# Altium schematic sheet Peripheral Sheet.SchDoc
size A4; SheetNumber: 3; SheetTotal: 5
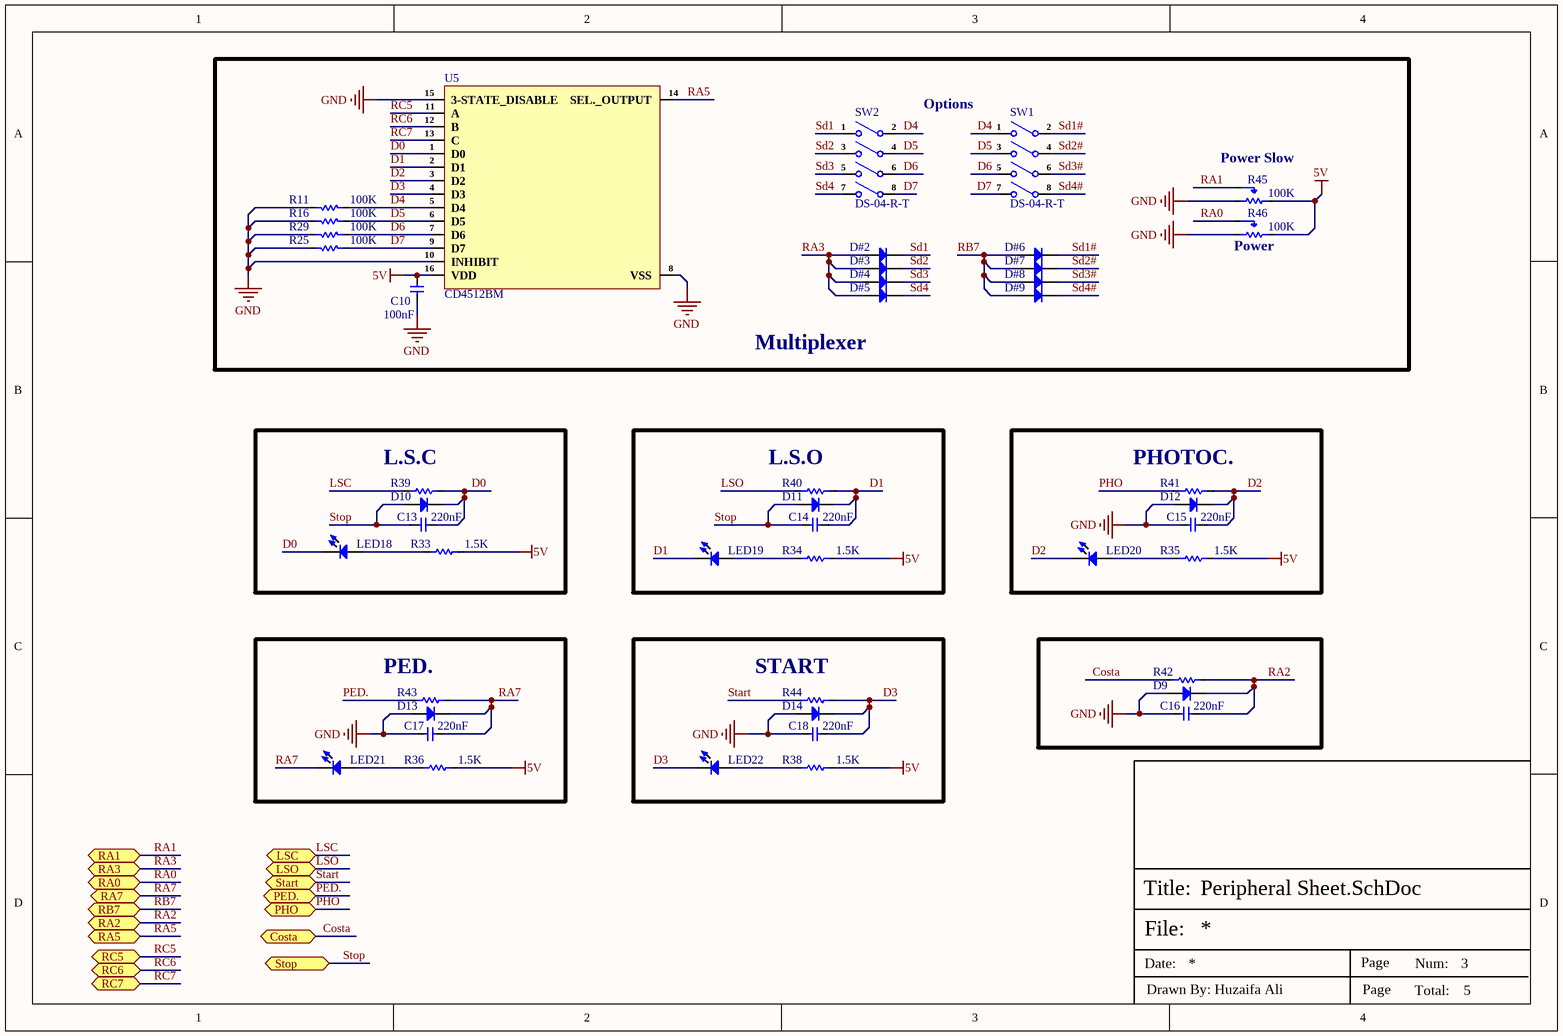
[diagram p0: Peripheral Sheet.SchDoc]

## Parts
C10  100nF  [Cap-0603]
C13  220nF  [Cap-0805]
C14  220nF  [Cap-0805]
C15  220nF  [Cap-0805]
C16  220nF  [Cap-0805]
C17  220nF  [Cap-0805]
C18  220nF  [Cap-0805]
D9  1N4148W-7-F  [SOD-123]  (value not drawn)
D10  1N4148W-7-F  [SOD-123]  (value not drawn)
D11  1N4148W-7-F  [SOD-123]  (value not drawn)
D12  1N4148W-7-F  [SOD-123]  (value not drawn)
D13  1N4148W-7-F  [SOD-123]  (value not drawn)
D14  1N4148W-7-F  [SOD-123]  (value not drawn)
D#2  1N4148W-7-F  [SOD-123]  (value not drawn)
D#3  1N4148W-7-F  [SOD-123]  (value not drawn)
D#4  1N4148W-7-F  [SOD-123]  (value not drawn)
D#5  1N4148W-7-F  [SOD-123]  (value not drawn)
D#6  1N4148W-7-F  [SOD-123]  (value not drawn)
D#7  1N4148W-7-F  [SOD-123]  (value not drawn)
D#8  1N4148W-7-F  [SOD-123]  (value not drawn)
D#9  1N4148W-7-F  [SOD-123]  (value not drawn)
LED18  Blue  [LED-0603]  (value not drawn)
LED19  Blue  [LED-0603]  (value not drawn)
LED20  Blue  [LED-0603]  (value not drawn)
LED21  Blue  [LED-0603]  (value not drawn)
LED22  Blue  [LED-0603]  (value not drawn)
R11  100K  [Res-0603]
R16  100K  [Res-0603]
R25  100K  [Res-0603]
R29  100K  [Res-0603]
R33  1.5K  [Res-0603]
R34  1.5K  [Res-0603]
R35  1.5K  [Res-0603]
R36  1.5K  [Res-0603]
R38  1.5K  [Res-0603]
R39  100R  [Res-0603]  (value not drawn)
R40  100R  [Res-0603]  (value not drawn)
R41  100R  [Res-0603]  (value not drawn)
R42  100R  [Res-0603]  (value not drawn)
R43  100R  [Res-0603]  (value not drawn)
R44  100R  [Res-0603]  (value not drawn)
R45  100K  [PT15-L-V-104(100K)]
R46  100K  [PT15-L-V-104(100K)]
SW1  DS-04-R-T  [DS-04-R-T]
SW2  DS-04-R-T  [DS-04-R-T]
U5  CD4512BM  [SOIC-16]

## Blocks framed on the sheet
Multiplexer: C10 D#2-D#9 R11 R16 R25 R29 R45 R46 SW1 SW2 U5
L.S.C: C13 D10 LED18 R33 R39
L.S.O: C14 D11 LED19 R34 R40
PHOTOC.: C15 D12 LED20 R35 R41
PED.: C17 D13 LED21 R36 R43
START: C18 D14 LED22 R38 R44

## Ports
Costa (bidir, see Top Sheet[3B], Connector Sheet[1D], Controller Sheet[1D]), LSC (bidir, see Top Sheet[3B], Connector Sheet[1C]), LSO (bidir, see Top Sheet[3B], Connector Sheet[1C]), PED. (bidir, see Top Sheet[3B], Connector Sheet[1C]), PHO (bidir, see Top Sheet[3B], Connector Sheet[1C]), RA0 (bidir, see Top Sheet[3B], Controller Sheet[1D]), RA1 (bidir, see Top Sheet[3B], Controller Sheet[1D]), RA2 (bidir, see Top Sheet[3B], Controller Sheet[1D]), RA3 (bidir, see Top Sheet[3B], Controller Sheet[1D]), RA5 (bidir, see Top Sheet[3C], Controller Sheet[1D]), RA7 (bidir, see Top Sheet[3C], Controller Sheet[1D]), RB7 (bidir, see Top Sheet[3C], Controller Sheet[1D]), RC5 (bidir, see Top Sheet[3C], Controller Sheet[1D]), RC6 (bidir, see Top Sheet[3C], Controller Sheet[1D]), RC7 (bidir, see Top Sheet[3C], Controller Sheet[1D]), Start (bidir, see Top Sheet[3A], Connector Sheet[1C]), Stop (bidir, see Top Sheet[3B], Connector Sheet[1D])

## Nets
5V: C10.2 R33.1 R34.1 R35.1 R36.1 R38.1 R45.3(CW) R46.3(CW) U5.16(VDD)
GND: C10.1 C15.1 C16.1 C17.1 C18.1 D9.1(A) D12.1(A) D13.1(A) D14.1(A) R11.2 R16.2 R25.2 R29.2 R45.1(CCW) R46.1(CCW) U5.8(VSS) U5.10(INHIBIT) U5.15(3-STATE_DISABLE)
Costa: R42.2 ; port Costa
D0: C13.2 D10.2(K) LED18.2 R39.1 U5.1(D0)
D1: C14.2 D11.2(K) LED19.2 R40.1 U5.2(D1)
D2: C15.2 D12.2(K) LED20.2 R41.1 U5.3(D2)
D3: C18.2 D14.2(K) LED22.2 R44.1 U5.4(D3)
D4: R11.1 SW1.1 SW2.2 U5.5(D4)
D5: R16.1 SW1.3 SW2.4 U5.6(D5)
D6: R29.1 SW1.5 SW2.6 U5.7(D6)
D7: R25.1 SW1.7 SW2.8 U5.9(D7)
LSC: R39.2 ; port LSC
LSO: R40.2 ; port LSO
PED.: R43.2 ; port PED.
PHO: R41.2 ; port PHO
RA0: R46.2(Wiper) ; port RA0
RA1: R45.2(Wiper) ; port RA1
RA2: C16.2 D9.2(K) R42.1 ; port RA2
RA3: D#2.1(A) D#3.1(A) D#4.1(A) D#5.1(A) ; port RA3
RA5: U5.14(SEL._OUTPUT) ; port RA5
RA7: C17.2 D13.2(K) LED21.2 R43.1 ; port RA7
RB7: D#6.1(A) D#7.1(A) D#8.1(A) D#9.1(A) ; port RB7
RC5: U5.11(A) ; port RC5
RC6: U5.12(B) ; port RC6
RC7: U5.13(C) ; port RC7
Sd1: D#2.2(K) SW2.1
Sd1#: D#6.2(K) SW1.2
Sd2: D#3.2(K) SW2.3
Sd2#: D#7.2(K) SW1.4
Sd3: D#4.2(K) SW2.5
Sd3#: D#8.2(K) SW1.6
Sd4: D#5.2(K) SW2.7
Sd4#: D#9.2(K) SW1.8
Start: R44.2 ; port Start
Stop: C13.1 C14.1 D10.1(A) D11.1(A) ; port Stop
NetLED18_1: LED18.1 R33.2
NetLED19_1: LED19.1 R34.2
NetLED20_1: LED20.1 R35.2
NetLED21_1: LED21.1 R36.2
NetLED22_1: LED22.1 R38.2

## Notes on the sheet
- Options
- (near R45) Power Slow
- (near R46) Power
- File:
- Title:
- Date:
- Page
- Num:
- Total:
- Drawn By: Huzaifa Ali

## Library data of the parts
C10 = CC0603KRX5R9BB104: CAP CER 0.1UF 50V X5R 0603; Manufacturer: Yageo; Tolerance: 10%; Item Type: Capacitor; Supplier 1: Digi-Key; Manufacturer Part Number: CC0603KRX5R9BB104; RoHS: Yes; Category: Ceramic Capacitors; Stock 1: 152253; Pricing 1: 1=0.10000, 10=0.05200, 50=0.02820, 100=0.02310, 500=0.01648, 1000=0.01294 (USD); Mount: Surface Mount; Case/Package: 0603; Case Code (Imperial): 0603; Case Code (Metric): 1608; Weight: 7.1E-05oz; Min Operating Temperature: -55°C; Max Operating Temperature: 85°C; Capacitance: 100nF; Packaging: Tape and Reel; Voltage Rating: 50V; Dielectric: X5R; Termination: SMD/SMT; Voltage Rating (DC): 50V; Package Quantity: 4000; Length: 0.063inch; Width: 0.031inch; Thickness: 0.035inch; Lead Free: Lead Free; Halogen Free: Halogen Free; ComponentLink1URL: http://www.mouser.com/ds/2/447/Yageo_UPY-GP_NP0_16V-to-50V_9-358835.pdf?src-supplier=Mouser; ComponentLink1Description: http://www.mouser.com/ds/2/447/Yageo_UPY-GP_NP0_16V-to-50V_9-358835.pdf?src-supplier=Mouser; ComponentLink2URL: https://www.yageo.com/upload/media/product/productsearch/datasheet/mlcc/UPY-GPHC_X5R_4V-to-50V_26.pdf?src-supplier=Digi-Key; ComponentLink2Description: https://www.yageo.com/upload/media/product/productsearch/datasheet/mlcc/UPY-GPHC_X5R_4V-to-50V_26.pdf?src-supplier=Digi-Key; ComponentLink3URL: http://www.yageo.com/exep/pages/download/literatures/ProductSelectionGuide%202014_Final_2.pdf?src-supplier=Digi-Key; ComponentLink3Description: http://www.yageo.com/exep/pages/download/literatures/ProductSelectionGuide%202014_Final_2.pdf?src-supplier=Digi-Key; Supplier Part Number 1: 311-4046-1-ND; LCSC Part Number: C110022
C13-C18 = 08051C224K4T2A: CAP CER 0.22UF 100V X7R 0805; Manufacturer: Kyocera AVX; Tolerance: 10%; Item Type: Capacitor; Supplier 1: Digi-Key; Manufacturer Part Number: 08051C224K4T2A; RoHS: Yes; Category: Ceramic Capacitors; Stock 1: 151; Pricing 1: 1=0.27000, 10=0.18500, 50=0.12320, 100=0.10470, 500=0.07392, 1000=0.06468 (USD); Mount: Surface Mount; Case/Package: 0805; Contact Plating: Tin; Min Operating Temperature: -55°C; Max Operating Temperature: 125°C; Termination: Wraparound; Capacitance: 220nF; Dielectric: X7R; Voltage Rating (DC): 100V; Length: 2.01mm; RoHS Compliant: Yes; ComponentLink1URL: http://datasheets.avx.com/AutoMLCC.pdf?src-supplier=Avnet+Asia; ComponentLink1Description: http://datasheets.avx.com/AutoMLCC.pdf?src-supplier=Avnet+Asia; Supplier Part Number 1: 478-13049-1-ND; LCSC Part Number: C2176107
D9-D14 D#2-D#9 = 1N4148W-7-F: DIODE GEN PURP 100V 300MA SOD123; Manufacturer: Diodes; Forward Current: 150mA; Reverse Recovery Time: 4ns; Max Forward Surge Current (Ifsm): 2A; Element Configuration: Single; Max Reverse Current: 1uA; Forward Voltage: 1.25V; Power Dissipation: 400mW; Polarity: Standard; Voltage Rating (DC): 75V; Value: 2pF; Supplier 1: Future Electronics; Manufacturer Part Number: 1N4148W-7-F; RoHS: Yes; Category: Rectifier Diodes; Stock 1: 32931000; Pricing 1: 3000=0.01840, 12000=0.01760, 45000=0.01690, 120000=0.01640, 300000=0.01560 (USD); Mounting Technology: Surface Mount; Pins: 2; Weight: 0.000353oz; Contact Plating: Tin,Matte; Min Operating Temperature: -65°C; Max Operating Temperature: 150°C; Packaging: Tape and Reel; Max Repetitive Reverse Voltage (Vrrm): 100V; Peak Non-Repetitive Surge Current: 2A; Voltage: 100V; Max Surge Current: 2A; Package Quantity: 3000; Recovery Time: 4ns; Average Rectified Current: 300mA; Power Rating: 400mW; Current Rating: 150mA; Output Current: 150mA; Max Reverse Voltage (DC): 100V; Series: -; Reverse Recovery Time-Max: 4ns; Length: 2.85mm; Width: 1.7mm; Height: 1.25mm; Radiation Hardening: No; RoHS Compliant: Yes; Reach SVHC Compliant: Yes; Lead Free: Lead Free; ComponentLink1URL: https://datasheet.ciiva.com/1179/1915529-1179304.pdf?src-supplier=Element14; ComponentLink1Description: https://datasheet.ciiva.com/1179/1915529-1179304.pdf?src-supplier=Element14; ComponentLink2URL: https://datasheet.ciiva.com/22695/1915529-22695239.pdf?src-supplier=Element14; ComponentLink2Description: https://datasheet.ciiva.com/22695/1915529-22695239.pdf?src-supplier=Element14; ComponentLink3URL: https://datasheet.ciiva.com/8300/ds30086-8300392.pdf?src-supplier=Avnet; ComponentLink3Description: https://datasheet.ciiva.com/8300/ds30086-8300392.pdf?src-supplier=Avnet; ComponentLink4URL: https://datasheet.ciiva.com/15219/getdatasheetpartid-110030-15219548.pdf?src-supplier=Verical; ComponentLink4Description: https://datasheet.ciiva.com/15219/getdatasheetpartid-110030-15219548.pdf?src-supplier=Verical; ComponentLink5URL: https://datasheet.ciiva.com/8303/ds30086-8303197.pdf?src-supplier=Avnet; ComponentLink5Description: https://datasheet.ciiva.com/8303/ds30086-8303197.pdf?src-supplier=Avnet; ComponentLink6URL: https://datasheet.ciiva.com/911/ds30086-911735.pdf?src-supplier=Digi-Key; ComponentLink6Description: https://datasheet.ciiva.com/911/ds30086-911735.pdf?src-supplier=Digi-Key; ComponentLink7URL: https://datasheet.ciiva.com/911/ds30086-911736.pdf?src-supplier=Digi-Key; ComponentLink7Description: https://datasheet.ciiva.com/911/ds30086-911736.pdf?src-supplier=Digi-Key; ComponentLink8URL: https://datasheet.ciiva.com/911/ds30086-911734.pdf?src-supplier=Digi-Key; ComponentLink8Description: https://datasheet.ciiva.com/911/ds30086-911734.pdf?src-supplier=Digi-Key; ComponentLink9URL: https://datasheet.ciiva.com/4435/ds30086-4435128.pdf?src-supplier=Mouser; ComponentLink9Description: https://datasheet.ciiva.com/4435/ds30086-4435128.pdf?src-supplier=Mouser; Supplier Part Number 1: 7634694; LCSC Part Number: C83528; Item Type: Diode
LED18-LED22 = NCD0603B3: blue 0603 Light Emitting Diodes (LED) ROHS; Manufacturer: Foshan NationStar Optoelectronics; Manufacturer Part Number: NCD0603B3; Package: 0603; LCSC Part Number: C158101; Item Type: LED; ComponentLink1Description: LCSC; ComponentLink1URL: https://www.lcsc.com/product-detail/Light-Emitting-Diodes-LED_Foshan-NationStar-Optoelectronics-NCD0603B3_C158101.html
R11 R16 R25 R29 = RC0603JR-07100KL: RES 100K OHM 5% 1/10W 0603; Manufacturer: Yageo; Resistance: 100kR; Temperature Coefficient: 100ppm/°C; Voltage Rating: 50V; Power Rating: 100mW; Item Type: Resistor; Supplier 1: Digi-Key; Manufacturer Part Number: RC0603JR-07100KL; RoHS: Yes; Category: Chip SMD Resistors; Stock 1: 1210037; Pricing 1: 1=0.10000, 10=0.02000, 100=0.00800, 1000=0.00360, 2500=0.00312 (USD); Case/Package: 0603; Number of Pins: 2; Contact Plating: Tin,Matte; Case Code (Imperial): 0603; Case Code (Metric): 1608; Size Code: 0603; Min Operating Temperature: -55°C; Max Operating Temperature: 155°C; Tolerance: 5%; Resistor Type: Thick Film; Packaging: Tape and Reel; Voltage Rating (DC): 50V; Termination: SMD/SMT; Features: Moisture Resistant; Series: RC; Max Power Dissipation: 100mW; Number of Terminations: 2; Resistance Tolerance: 5%; Width: 0.8mm; Radiation Hardening: No; REACH SVHC: No SVHC; Lead Free: Lead Free; RoHS Compliant: Yes; ComponentLink1URL: https://datasheet.ciiva.com/7746/443971-7746424.pdf?src-supplier=Element14; ComponentLink1Description: https://datasheet.ciiva.com/7746/443971-7746424.pdf?src-supplier=Element14; ComponentLink2URL: https://datasheet.ciiva.com/7983/443971-7983686.pdf?src-supplier=Element14; ComponentLink2Description: https://datasheet.ciiva.com/7983/443971-7983686.pdf?src-supplier=Element14; ComponentLink3URL: https://datasheet.ciiva.com/7746/443971-7746423.pdf?src-supplier=Element14; ComponentLink3Description: https://datasheet.ciiva.com/7746/443971-7746423.pdf?src-supplier=Element14; ComponentLink4URL: https://datasheet.ciiva.com/8887/pyu-rc0603-51-rohs-l-4-8887903.pdf?src-supplier=Avnet; ComponentLink4Description: https://datasheet.ciiva.com/8887/pyu-rc0603-51-rohs-l-4-8887903.pdf?src-supplier=Avnet; Supplier Part Number 1: 311-100KGRCT-ND; LCSC Part Number: C100048
R33-R36 R38 = RC0603FR-071K5L: RES 1.5K OHM 1% 1/10W 0603; Manufacturer: Yageo; Voltage Rating (DC): 50V; Resistance: 1.5kR; Temperature Coefficient: 100ppm/°C; Power Rating: 100mW; Item Type: Resistor; Supplier 1: Arrow Electronics; Manufacturer Part Number: RC0603FR-071K5L; RoHS: Yes; Category: Chip SMD Resistors; Stock 1: 15000; Pricing 1: 1=0.00160, 5000=0.00160 (USD); Case/Package: 0603; Number of Pins: 2; Case Code (Metric): 1608; Case Code (Imperial): 0603; Size Code: 0603; Min Operating Temperature: -55°C; Max Operating Temperature: 155°C; Tolerance: 1%; Packaging: Tape and Reel; Resistor Type: Thick Film; Voltage Rating: 50V; Package Quantity: 1; Number of Terminations: 2; Termination: SMD/SMT; Max Power Dissipation: 100mW; Features: Moisture Resistant; Series: RC; Resistance Tolerance: 1%; Construction: Rectangular; Length: 0.063inch; Width: 0.031inch; Height: 0.022inch; Depth: 0.8mm; REACH SVHC: No SVHC; Lead Free: Lead Free; Military Standard: Not; RoHS Compliant: Yes; Supplier Part Number 1: RC0603FR-071K5L; LCSC Part Number: C114668
R39-R44 = RC0603FR-07100RL: RES SMD 100 OHM 1% 1/10W 0603; Manufacturer: Yageo; Temperature Coefficient: 100ppm/°C; Voltage Rating (DC): 50V; Power Rating: 100mW; Item Type: Resistor; Supplier 1: Arrow Electronics; Manufacturer Part Number: RC0603FR-07100RL; RoHS: Yes; Category: Chip SMD Resistors; Stock 1: 3800000; Pricing 1: 5000=0.00300, 5000=0.00200, 5000=0.00450, 50000=0.00410, 500000=0.00230, 2500000=0.00140 (USD); Case/Package: 0603; Number of Pins: 2; Case Code (Imperial): 0603; Case Code (Metric): 1608; Size Code: 0603; Min Operating Temperature: -55°C; Max Operating Temperature: 155°C; Resistance: 100R; Tolerance: 1%; Resistor Type: Thick Film; Packaging: Tape and Reel; Voltage Rating: 50V; Termination: SMD/SMT; Features: Moisture Resistant; Series: RC; Max Power Dissipation: 100mW; Number of Terminations: 2; Construction: Rectangular; Resistance Tolerance: 1%; Technology: THICK FILM; Length: 1.6mm; Width: 0.8mm; Height: 0.45mm; Depth: 0.8mm; REACH SVHC: Unknown; Lead Free: Lead Free; RoHS Compliant: Yes; Military Standard: Not; Supplier Part Number 1: RC0603FR-07100RL; LCSC Part Number: C105588
R45 R46 = PT15-L-V-104(100K): ±20% 250mW 100kΩ - Variable Resistors/Potentiometers ROHS; Manufacturer: BOCHEN; Manufacturer Part Number: PT15-L-V-104(100K); Package: Custom; LCSC Part Number: C5205120; Item Type: Potentiometer; ComponentLink1Description: LCSC; ComponentLink1URL: https://www.lcsc.com/product-detail/Variable-Resistors-Potentiometers_BOCHEN-Chengdu-Guosheng-Tech-PT15-L-V-104-100K_C5205120.html
SW1 SW2 = DS-04-R-T: 4Bit SPST 24V Red 25mA 3000次 Plugin DIP Switches ROHS; Manufacturer: kangshen; Manufacturer Part Number: 208-4; Package: Plugin; LCSC Part Number: C5123702; Item Type: DIP Switch; ComponentLink1Description: LCSC; ComponentLink1URL: https://www.lcsc.com/product-detail/DIP-Switches_CTS-Electronic-Components-208-4_C3012341.html
U5 = CD4512BM: Multiplexer 1-Element CMOS 3-ST 8-IN 16-Pin SOIC Tube; Manufacturer: Texas Instruments; Item Type: IC; Supplier: Mouser; Supplier Part Number: 595-CD4512BM; Manufacturer Part Number: CD4512BM; RoHS: Yes; Category: Integrated Circuits (ICs); Stock: 768; Pricing: 1=1.21, 10=1.03, 50=1.03, 100=1.03, 120=0.789, 520=0.718, 1000=0.542, 2520=0.529, 5000=0.512, 10000=0.505, 25000=0.499 (USD); ComponentLink1URL: https://datasheet.ciiva.com/15087/getdatasheetpartid-393294-15087392.pdf?src-supplier=Verical; ComponentLink1Description: https://datasheet.ciiva.com/15087/getdatasheetpartid-393294-15087392.pdf?src-supplier=Verical; ComponentLink2URL: https://datasheet.ciiva.com/1629/cd4512b-1629722.pdf?src-supplier=Newark; ComponentLink2Description: https://datasheet.ciiva.com/1629/cd4512b-1629722.pdf?src-supplier=Newark; ComponentLink3URL: https://datasheet.ciiva.com/6619/cd4512b-6619077.pdf?src-supplier=Digi-Key; ComponentLink3Description: https://datasheet.ciiva.com/6619/cd4512b-6619077.pdf?src-supplier=Digi-Key; ComponentLink4URL: https://datasheet.ciiva.com/14285/cd4512b-mil-14285481.pdf?src-supplier=Avnet; ComponentLink4Description: https://datasheet.ciiva.com/14285/cd4512b-mil-14285481.pdf?src-supplier=Avnet; LCSC Part Number: C1547339